# Altium schematic sheet MCU_STM.SchDoc
size A; DocumentNumber: 3; SheetNumber: 4; SheetTotal: 14
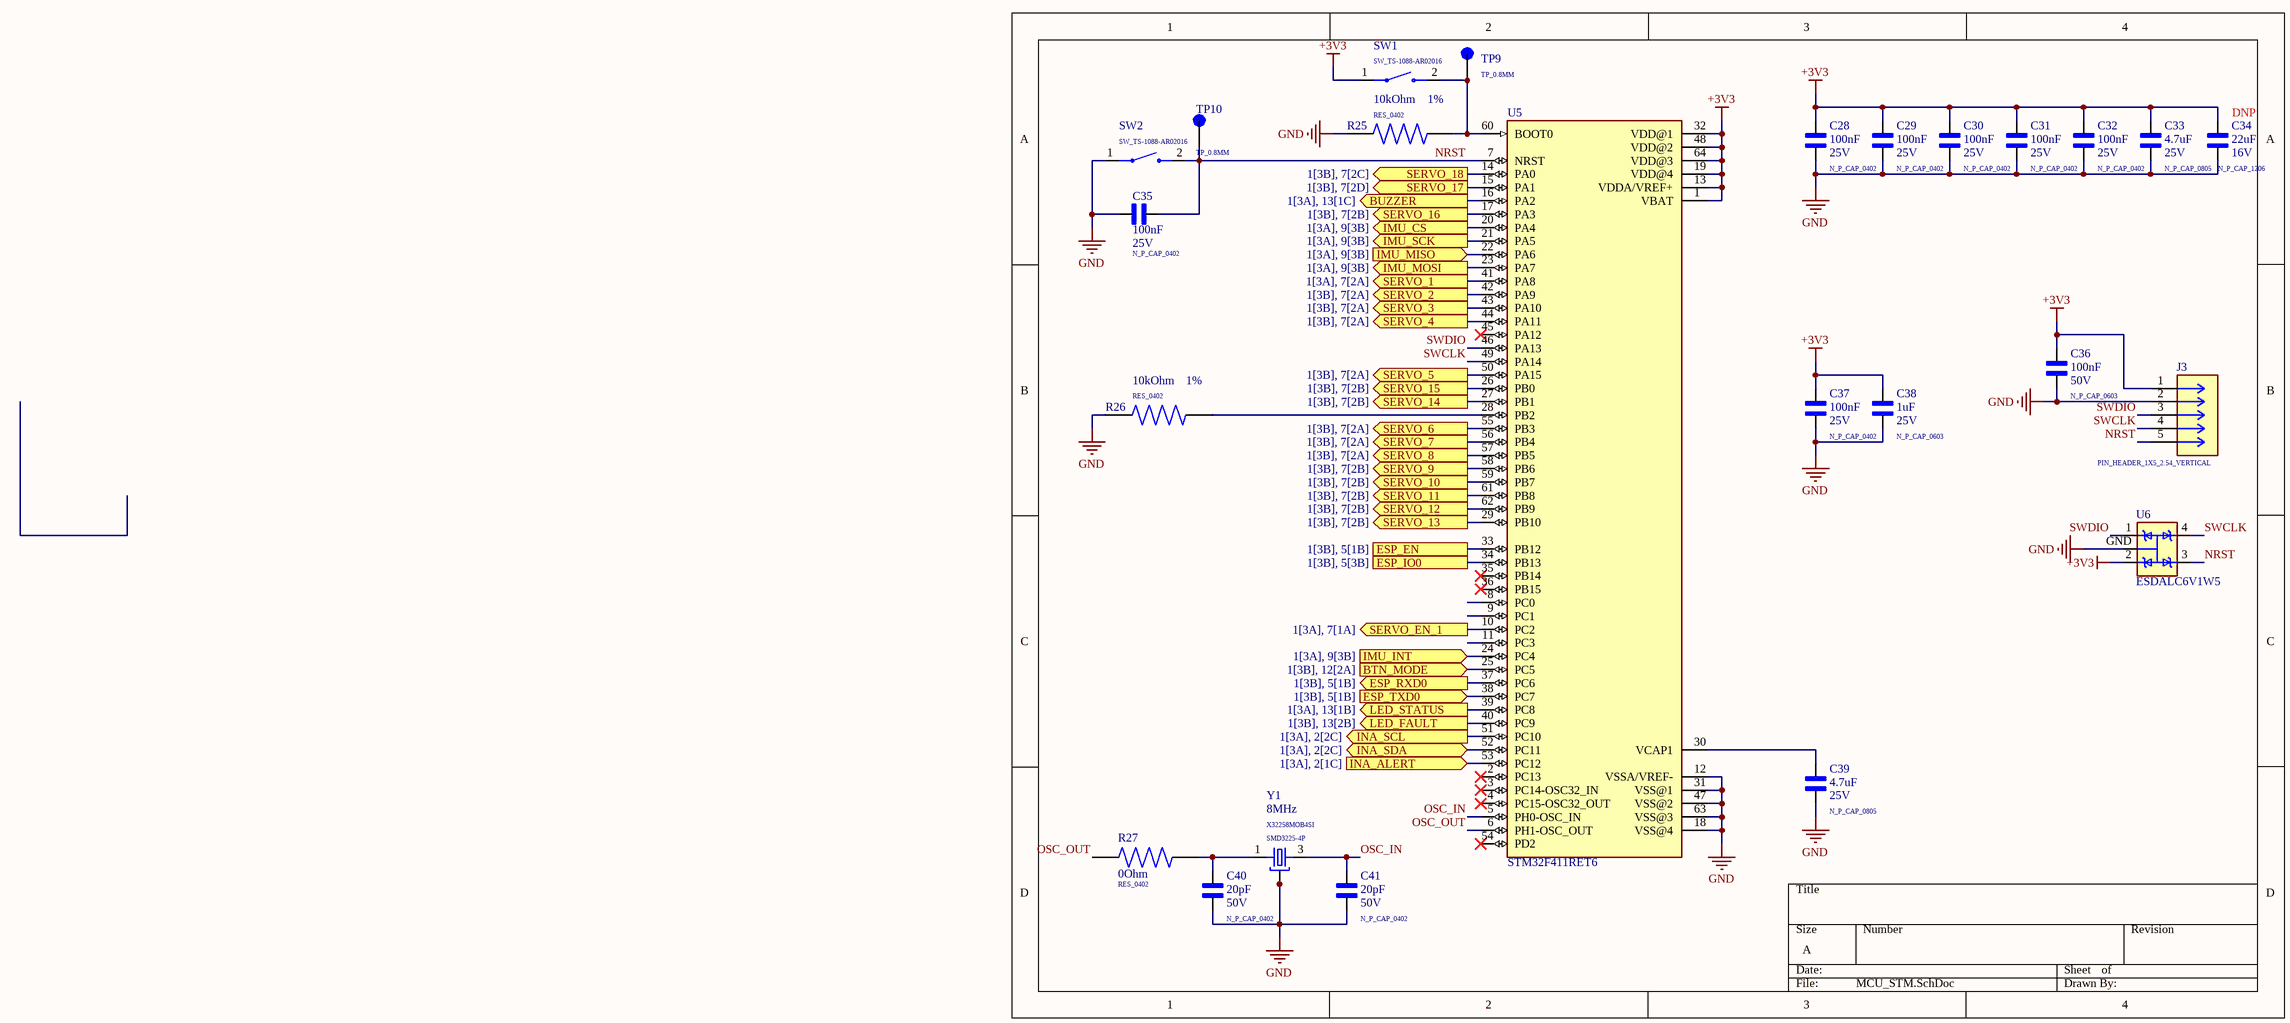
[diagram p0: MCU_STM.SchDoc]

## Parts
C28  N_P_CAP_0402  value 100nF  Rated Voltage: 25V  [N_P_CAP_0402]
C29  N_P_CAP_0402  value 100nF  Rated Voltage: 25V  [N_P_CAP_0402]
C30  N_P_CAP_0402  value 100nF  Rated Voltage: 25V  [N_P_CAP_0402]
C31  N_P_CAP_0402  value 100nF  Rated Voltage: 25V  [N_P_CAP_0402]
C32  N_P_CAP_0402  value 100nF  Rated Voltage: 25V  [N_P_CAP_0402]
C33  N_P_CAP_0805  value 4.7uF  Rated Voltage: 25V  [N_P_CAP_0805]
C34  N_P_CAP_1206  value 22uF  Rated Voltage: 16V  [N_P_CAP_1206]
C35  N_P_CAP_0402  value 100nF  Rated Voltage: 25V  [N_P_CAP_0402]
C36  N_P_CAP_0603  value 100nF  Rated Voltage: 50V  [N_P_CAP_0603]
C37  N_P_CAP_0402  value 100nF  Rated Voltage: 25V  [N_P_CAP_0402]
C38  N_P_CAP_0603  value 1uF  Rated Voltage: 25V  [N_P_CAP_0603]
C39  N_P_CAP_0805  value 4.7uF  Rated Voltage: 25V  [N_P_CAP_0805]
C40  N_P_CAP_0402  value 20pF  Rated Voltage: 50V  [N_P_CAP_0402]
C41  N_P_CAP_0402  value 20pF  Rated Voltage: 50V  [N_P_CAP_0402]
J3  PIN_HEADER_1X5_2.54_VERTICAL  [PIN_HEADER_1X5_2.54_VERTICAL]
R25  RES_0402  value 10kOhm  Tolerance: 1%  [RES_0402]
R26  RES_0402  value 10kOhm  Tolerance: 1%  [RES_0402]
R27  RES_0402  value 0Ohm  [RES_0402]
SW1  SW_TS-1088-AR02016  [SW_TS-1088-AR02016]
SW2  SW_TS-1088-AR02016  [SW_TS-1088-AR02016]
TP9  TP_0.8MM  [TP_0.8MM]
TP10  TP_0.8MM  [TP_0.8MM]
U5  STM32F411RET6  [QFP50P1200X1200X160-64N]
U6  ESDALC6V1W5  [SOT323-5L]
Y1  SMD3225-4P  Frequency: 8MHz  MPN: X32258MOB4SI  [SMD3225-4P]

## Ports
BTN_MODE (in, see 1[3B], 12[2A]), BUZZER (out, see 1[3A], 13[1C]), ESP_EN (see 1[3B], 5[1B]), ESP_IO0 (see 1[3B], 5[3B]), ESP_RXD0 (out, see 1[3B], 5[1B]), ESP_TXD0 (in, see 1[3B], 5[1B]), IMU_CS (out, see 1[3A], 9[3B]), IMU_INT (in, see 1[3A], 9[3B]), IMU_MISO (in, see 1[3A], 9[3B]), IMU_MOSI (out, see 1[3A], 9[3B]), IMU_SCK (out, see 1[3A], 9[3B]), INA_ALERT (in, see 1[3A], 2[1C]), INA_SCL (out, see 1[3A], 2[2C]), INA_SDA (bidir, see 1[3A], 2[2C]), LED_FAULT (out, see 1[3B], 13[2B]), LED_STATUS (out, see 1[3A], 13[1B]), SERVO_1 (out, see 1[3A], 7[2A]), SERVO_2 (out, see 1[3B], 7[2A]), SERVO_3 (out, see 1[3B], 7[2A]), SERVO_4 (out, see 1[3B], 7[2A]), SERVO_5 (out, see 1[3B], 7[2A]), SERVO_6 (out, see 1[3B], 7[2A]), SERVO_7 (out, see 1[3B], 7[2A]), SERVO_8 (out, see 1[3B], 7[2A]), SERVO_9 (out, see 1[3B], 7[2B]), SERVO_10 (out, see 1[3B], 7[2B]), SERVO_11 (out, see 1[3B], 7[2B]), SERVO_12 (out, see 1[3B], 7[2B]), SERVO_13 (out, see 1[3B], 7[2B]), SERVO_14 (out, see 1[3B], 7[2B]), SERVO_15 (out, see 1[3B], 7[2B]), SERVO_16 (out, see 1[3B], 7[2B]), SERVO_17 (out, see 1[3B], 7[2D]), SERVO_18 (out, see 1[3B], 7[2C]), SERVO_EN_1 (out, see 1[3A], 7[1A])

## Nets
+3V3: C28.2 C29.2 C30.2 C31.2 C32.2 C33.2 C34.2 C36.2 C37.2 C38.2 J3.1 SW1.1 U5.1(VBAT) U5.13(VDDA/VREF+) U5.19(VDD@4) U5.32(VDD@1) U5.48(VDD@2) U5.64(VDD@3) U6.2(I/02)
GND: C28.1 C29.1 C30.1 C31.1 C32.1 C33.1 C34.1 C35.1 C36.1 C37.1 C38.1 C39.1 C40.1 C41.1 J3.2 R25.2 R26.2 SW2.1 U5.12(VSSA/VREF-) U5.18(VSS@4) U5.31(VSS@1) U5.47(VSS@2) U5.63(VSS@3) U6.GND Y1.2(GND) Y1.4(GND)
BTN_MODE: U5.25(PC5) ; port BTN_MODE
BUZZER: U5.16(PA2) ; port BUZZER
ESP_EN: U5.33(PB12) ; port ESP_EN
ESP_IO0: U5.34(PB13) ; port ESP_IO0
ESP_RXD0: U5.37(PC6) ; port ESP_RXD0
ESP_TXD0: U5.38(PC7) ; port ESP_TXD0
IMU_CS: U5.20(PA4) ; port IMU_CS
IMU_INT: U5.24(PC4) ; port IMU_INT
IMU_MISO: U5.22(PA6) ; port IMU_MISO
IMU_MOSI: U5.23(PA7) ; port IMU_MOSI
IMU_SCK: U5.21(PA5) ; port IMU_SCK
INA_ALERT: U5.53(PC12) ; port INA_ALERT
INA_SCL: U5.51(PC10) ; port INA_SCL
INA_SDA: U5.52(PC11) ; port INA_SDA
LED_FAULT: U5.40(PC9) ; port LED_FAULT
LED_STATUS: U5.39(PC8) ; port LED_STATUS
NRST: C35.2 J3.5 SW2.2 TP10.TP U5.7(NRST) U6.3(I/03)
OSC_IN: C41.2 U5.5(PH0-OSC_IN) Y1.3
OSC_OUT: R27.2 U5.6(PH1-OSC_OUT)
SERVO_1: U5.41(PA8) ; port SERVO_1
SERVO_2: U5.42(PA9) ; port SERVO_2
SERVO_3: U5.43(PA10) ; port SERVO_3
SERVO_4: U5.44(PA11) ; port SERVO_4
SERVO_5: U5.50(PA15) ; port SERVO_5
SERVO_6: U5.55(PB3) ; port SERVO_6
SERVO_7: U5.56(PB4) ; port SERVO_7
SERVO_8: U5.57(PB5) ; port SERVO_8
SERVO_9: U5.58(PB6) ; port SERVO_9
SERVO_10: U5.59(PB7) ; port SERVO_10
SERVO_11: U5.61(PB8) ; port SERVO_11
SERVO_12: U5.62(PB9) ; port SERVO_12
SERVO_13: U5.29(PB10) ; port SERVO_13
SERVO_14: U5.27(PB1) ; port SERVO_14
SERVO_15: U5.26(PB0) ; port SERVO_15
SERVO_16: U5.17(PA3) ; port SERVO_16
SERVO_17: U5.15(PA1) ; port SERVO_17
SERVO_18: U5.14(PA0) ; port SERVO_18
SERVO_EN_1: U5.10(PC2) ; port SERVO_EN_1
SWCLK: J3.4 U5.49(PA14) U6.4(I/04)
SWDIO: J3.3 U5.46(PA13) U6.1(I/01)
NetC39_2: C39.2 U5.30(VCAP1)
NetC40_2: C40.2 R27.1 Y1.1
NetR25_1: R25.1 SW1.2 TP9.TP U5.60(BOOT0)
NetR26_1: R26.1 U5.28(PB2)

Not connected (* = marked no-connect by the designer): U5 2(PC13)* 3(PC14-OSC32_IN)* 4(PC15-OSC32_OUT)* 8(PC0) 9(PC1) 11(PC3) 35(PB14)* 36(PB15)* 45(PA12)* 54(PD2)*

## Notes on the sheet
- (near C34) DNP

## Library data of the parts
C28-C32 C35 C37 = N_P_CAP: GENERIC NON-POLARIZED CAP; Temperature Coefficient: X7R; LCSC Part Number: C105883; Tolerance: *; MF: *; ESR: *; MPN: *
C33 C36 C38 C39 = N_P_CAP: GENERIC NON-POLARIZED CAP; Tolerance: *; MF: *; ESR: *; MPN: *; Temperature Coefficient: *
  C33 C39: LCSC Part Number: C354262
  C36: LCSC Part Number: C106221
  C38: LCSC Part Number: C106858
C34 = N_P_CAP: GENERIC NON-POLARIZED CAP; MPN: CL31A226KOHNNNE; Tolerance: 10%; LCSC Part Number: C90146; MF: *; ESR: *; Temperature Coefficient: *
C40 C41 = N_P_CAP: GENERIC NON-POLARIZED CAP; Temperature Coefficient: NP0; LCSC Part Number: C107000; Tolerance: *; MF: *; ESR: *; MPN: *
J3 = PIN_HEADER_5P: GENERIC PIN HEADER 5P; MF: *; MPN: *; LCSC Part Number: *
R25 R26 = RES: GENERIC RES; Power Rating: *; MPN: *; Rated Voltage: *; Temperature Coefficient: *; LCSC Part Number: C60490
R27 = RES: GENERIC RES; Tolerance: 1%; Power Rating: *; MPN: *; Rated Voltage: *; Temperature Coefficient: *; LCSC Part Number: C106231
SW1 SW2 = TACTILE_SWITCH_NO_SPST_2P: GENERIC TACTILE SWITCH NO SPST 2P; MF: *; MPN: *; LCSC Part Number: *
TP9 TP10 = TEST_POINT: GENERIC TEST POINT; MF: *; MPN: *
U5 = STM32F411RET6: ARM Cortex-M4 STM32F4 Microcontroller IC 32-Bit 100MHz 512KB (512K x 8) FLASH 64-LQFP (10x10); MF: STMicroelectronics; Package: LQFP-64 STMicroelectronics; MPN: STM32F411RET6; LCSC Part Number: C94355
U6 = ESDALC6V1W5: Clamp Ipp Tvs Diode Surface Mount SOT-323-5; MF: STMicroelectronics; Package: SOT-323 STMicroelectronics; MPN: ESDALC6V1W5; LCSC Part Number: C703691
Y1 = XTAL_4P: GENERIC PASSIVE CRYSTAL; MF: YXC Crystal Oscillators; ESR: *; LCSC Part Number: C2682775; Load Capacitance: *; Frequency Tolerance: *